# Altium schematic sheet Sheet1.SchDoc
size A4; SheetNumber: 1; SheetTotal: 1
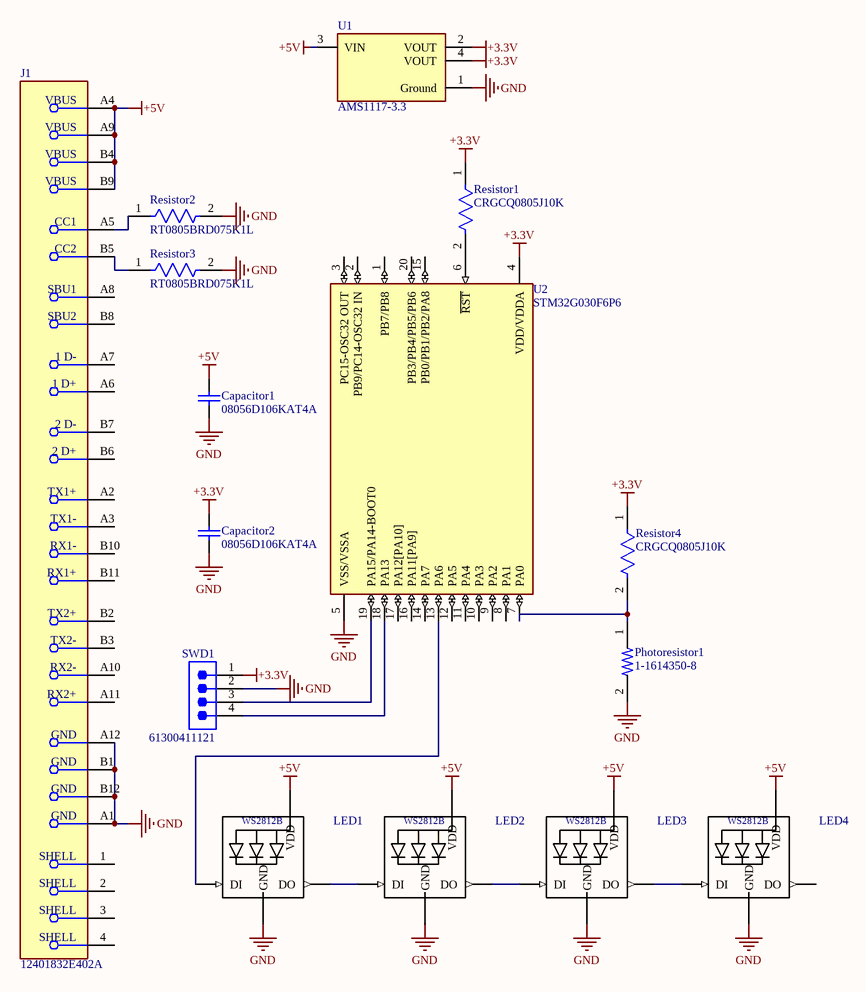
[diagram p0: Sheet1.SchDoc]

## Parts
Capacitor1  08056D106KAT4A  [CAPC2013X140X50ML20T25]
Capacitor2  08056D106KAT4A  [CAPC2013X140X50ML20T25]
J1  12401832E402A  [FP-12401832E402A-MFG]
LED1  WS2812B  [*WS2812B_WS2812B(Primary)]  (value not drawn)
LED2  WS2812B  [*WS2812B_WS2812B(Primary)]  (value not drawn)
LED3  WS2812B  [*WS2812B_WS2812B(Primary)]  (value not drawn)
LED4  WS2812B  [*WS2812B_WS2812B(Primary)]  (value not drawn)
Photoresistor1  1-1614350-8  [RESC1608X50N]
Resistor1  CRGCQ0805J10K  [FP-CRGCQ0805-IPC_C]
Resistor2  RT0805BRD075K1L  [FP-RT0805-MFG]
Resistor3  RT0805BRD075K1L  [FP-RT0805-MFG]
Resistor4  CRGCQ0805J10K  [FP-CRGCQ0805-IPC_C]
SWD1  61300411121  [61300411121]
U1  AMS1117-3.3  [FP-AMS1117-IPC_C]
U2  STM32G030F6P6  [FP-TSSOP20-YA-MFG]

## Nets
+3.3V: Capacitor2.2 Resistor1.1 Resistor4.1 SWD1.1 U1.2(VOUT) U1.4(VOUT) U2.4(VDD/VDDA)
+5V: Capacitor1.2 J1.A4(VBUS) J1.A9(VBUS) J1.B4(VBUS) J1.B9(VBUS) LED1.1-VDD(VDD) LED2.1-VDD(VDD) LED3.1-VDD(VDD) LED4.1-VDD(VDD) U1.3(VIN)
GND: Capacitor1.1 Capacitor2.1 J1.A1(GND) J1.A12(GND) J1.B1(GND) J1.B12(GND) LED1.3-GND(GND) LED2.3-GND(GND) LED3.3-GND(GND) LED4.3-GND(GND) Photoresistor1.2 Resistor2.2 Resistor3.2 SWD1.2 U1.1(Ground) U2.5(VSS/VSSA)
NetJ1_A5: J1.A5(CC1) Resistor2.1
NetJ1_B5: J1.B5(CC2) Resistor3.1
NetLED1_2-DOUT: LED1.2-DOUT(DO) LED2.4-DIN(DI)
NetLED1_4-DIN: LED1.4-DIN(DI) U2.13(PA6)
NetLED2_2-DOUT: LED2.2-DOUT(DO) LED3.4-DIN(DI)
NetLED3_2-DOUT: LED3.2-DOUT(DO) LED4.4-DIN(DI)
NetPhotoresistor1_1: Photoresistor1.1 Resistor4.2 U2.7(PA0)
NetResistor1_2: Resistor1.2 U2.6(~{RST})
NetSWD1_3: SWD1.3 U2.19(PA15/PA14-BOOT0)
NetSWD1_4: SWD1.4 U2.18(PA13)

Not connected (* = marked no-connect by the designer): J1 1(SHELL) 2(SHELL) 3(SHELL) 4(SHELL) A2(TX1+) A3(TX1-) A6(1_D+) A7(1_D-) A8(SBU1) A10(RX2-) A11(RX2+) B2(TX2+) B3(TX2-) B6(2_D+) B7(2_D-) B8(SBU2) B10(RX1-) B11(RX1+); LED4 2-DOUT(DO); U2 1(PB7/PB8) 2(PB9/PC14-OSC32_IN) 3(PC15-OSC32_OUT) 8(PA1) 9(PA2) 10(PA3) 11(PA4) 12(PA5) 14(PA7) 15(PB0/PB1/PB2/PA8) 16(PA11[PA9]) 17(PA12[PA10]) 20(PB3/PB4/PB5/PB6)

## Library data of the parts
Capacitor1 Capacitor2 = CMP-2007-04644-1: Manufacturer: AVX Interconnect / Elco; Part Number: 08056D106KAT4A
J1 = CMP-02355-000004-1: CONN RCP USB3.1 TYPEC 24P SMD RA
Photoresistor1 = 1-1614350-8: RN 0603 12K1 0.1% 10PPM CUT LENGTH / PDV-P2002; Package: None; Price: None; Value: *; MP: 1-1614350-8; Availability: Unavailable
Resistor1 Resistor4 = CMP-03211-002989-1: CRGCQ 0805 10K 5%; Manufacturer: TE Connectivity; Voltage Rating: 150V; Temperature Coefficient: ±100ppm/°C; Resistance: 10KΩ; Value: 10KΩ; Power Rating: 0.125W; Tolerance: 0.05; Automotive Grade: Grade 914; Height: 0.65mm; Lead Free: Yes; Temperature Range High: +155°C; Composition: Thick Film; Temperature Range Low: -55°C; Ambient Temperature Range High: +70°C; Temperature: -55°C to +155°C; Package: CRGCQ0805; Device Class L2: Resistors; RoHS: TRUE; ComponentLink2URL: https://www.te.com/commerce/DocumentDelivery/DDEController?Action=showdoc&DocId=Data+Sheet%7F1773204-3%7F1%7Fpdf%7FEnglish%7FENG_DS_1773204-3_1.pdf%7F4-2176341-923; Manufacturer Part Number: CRGCQ0805J10K; Series: CRGCQ; Device Class L1: Passive Components; Ipc Land Pattern Name: RESC200125X55; ComponentLink2Description: Datasheet; Category: Res; Digikey Description: CRGCQ 0805 10K 5%; Mouser Description: Res Thick Film 0805 10K Ohm 5% 0.125W(1/8W) ±100ppm/C Pad SMD Automotive T/R; Automotive: Yes; Octopart: https://octopart.com/crgcq0805j10k-te+connectivity-91018201; Device Class L3: Chip SMD Resistors
Resistor2 Resistor3 = CMP-2001-01553-2: RES SMD 5.1K OHM 0.1% 1/8W 0805; Manufacturer: Yageo; Value: 5.1KΩ; Voltage Rating: 150V; Power Rating: 0.125W; Temperature Coefficient: 25 ppm/°C; Tolerance: 0.0025; Footprint Url: http://www.yageo.com/exep/pages/download/literatures/PYu-R_Mount_10.pdf; Digikey Description: RES SMD 5.1K OHM 0.1% 1/8W 0805; Device Class L2: Resistors; Resistance: 5.1KΩ; Temperature Range Low: -55°C; Automotive: No; Lead Free: Yes; Composition: Thin Film; Octopart: https://octopart.com/rt0805brd075k1l-yageo-1209369; Temperature Range High: +155°C; RoHS: TRUE; Mouser Description: Res Thin Film 0805 5.1K Ohm 0.1% 1/8W ±10ppm/°C Molded SMD Paper T/R; ComponentLink2URL: http://www.yageo.com/documents/recent/PYu-RT_1-to-0.01_RoHS_L_9.pdf; Category: Res; Device Class L3: Chip SMD Resistors; ComponentLink2Description: Datasheet; Height: 0.6mm; Device Class L1: Passive Components; Package: RT0805; Temperature: -55°C to +155°C; Ipc Land Pattern Name: RESC200125X50; Series: RT; Manufacturer Part Number: RT0805BRD075K1L
SWD1 = CMP-1502-01064-4: THT Vertical Pin Header WR-PHD, Pitch 2.54 mm, Single Row, 4 pins; Connector Type: Male Pin; Gender: Male; Current Rating: 3A; Number of Positions: 4; Operating Supply Voltage: 250V; Contact Resistance: 20mΩ; Pitch: 2.54mm; Max Operating Temperature: 105°C; Mount: Through Hole; Contact Material: Gold; Contact Plating: Gold; Number of Contacts: 4; Orientation: Vertical; Packaging: Bulk; Contact Mating Length: 5.9944mm; Voltage Rating: 250V; Number of Rows: 1; Height: 8.89mm; Lead Free: Lead Free; Lead Pitch: 2.54mm; Number of Pins: 4; Color: Black; Min Operating Temperature: -40°C; RoHS: Compliant; Termination: Solder
U1 = CMP-209535-000001-1: LDO Voltage Regulators 1A, 3.3V; Manufacturer: Advanced Monolithic Systems; Dropout Voltage: 1.1V; Output Type: Fixed; Nominal Supply Current: 5mA; Max Power Dissipation: 1.2W; Max Supply Voltage: 15V; Number Of Outputs: 1; Standoff Height: 0.64mm; Max Junction Temp: +125°C; Height: 1.8mm; Package: AMS1117; Device Class L2: Power Management ICs; ComponentLink2Description: Datasheet; ComponentLink2URL: http://www.advanced-monolithic.com/pdf/ds1117.pdf; Category: IC; RoHS: TRUE; Automotive: No; Device Class L1: Integrated Circuits (ICs); Output Current: 1A; Device Class L3: Voltage Regulators - Linear; Temperature: -40°C to +125°C; Output Voltage: 3.3V; Manufacturer Part Number: AMS1117-3.3; Temperature Range Low: -40°C; Octopart: https://octopart.com/ams1117-3.3-advanced+monolithic+systems-25899300; Lead Free: Yes; Ipc Land Pattern Name: SOT229P700X180-4; Temperature Range High: +125°C
U2 = CMP-12105-000034-1: ARM MICROCONTROLLERS - MCU; Manufacturer: STMicroelectronics; Max Supply Voltage: 3.6V; Interface: I2C,SPI,USART,LIN,IrDA,I2S,SMBus; Memory Size: 32KBytes; Number Of I/Os: 17; Number Of Timers/Counters: 6; Core Architecture: ARM Cortex-M0+; Number Of Pwm Channels: 11; Standoff Height: 0.05mm; Number Of A/D Converters: 1; Number Of I2C Channels: 2; Data Bus Width: 32bits; Ram Size: 8KBytes; Max Junction Temp: +105°C; Number Of Spi Channels: 3; Min Supply Voltage: 2V; Number Of Adc Channels: 16; Memory Type: FLASH; Frequency: 64MHz; Ambient Temperature Range Low: -40°C; ComponentLink2URL: https://www.st.com/resource/en/datasheet/stm32g030f6.pdf; Temperature Range Low: -40°C; Automotive: No; Device Class L1: Integrated Circuits (ICs); Category: IC; Temperature Range High: +85°C; ComponentLink2Description: Datasheet; Device Class L2: Embedded Processors and Controllers; Manufacturer Part Number: STM32G030F6P6; Height: 1.2mm; Ambient Temperature Range High: +85°C; Octopart: https://octopart.com/stm32g030f6p6-stmicroelectronics-103773023; Package: TSSOP20-YA; Temperature: -40°C to +85°C; Lead Free: Yes; Device Class L3: Microcontrollers; Number Of Uart Channels: 2; RoHS: TRUE; Number Of Cores: 1; Digikey Description: ARM MICROCONTROLLERS - MCU
LED1-LED4 = WS2812B: SOURCE_URL: https://www.snapeda.com/parts/WS2812B/SparkFun/view-part/?ref=snap; Value: *